# Altium schematic sheet ESP-C05.schdoc
size A4
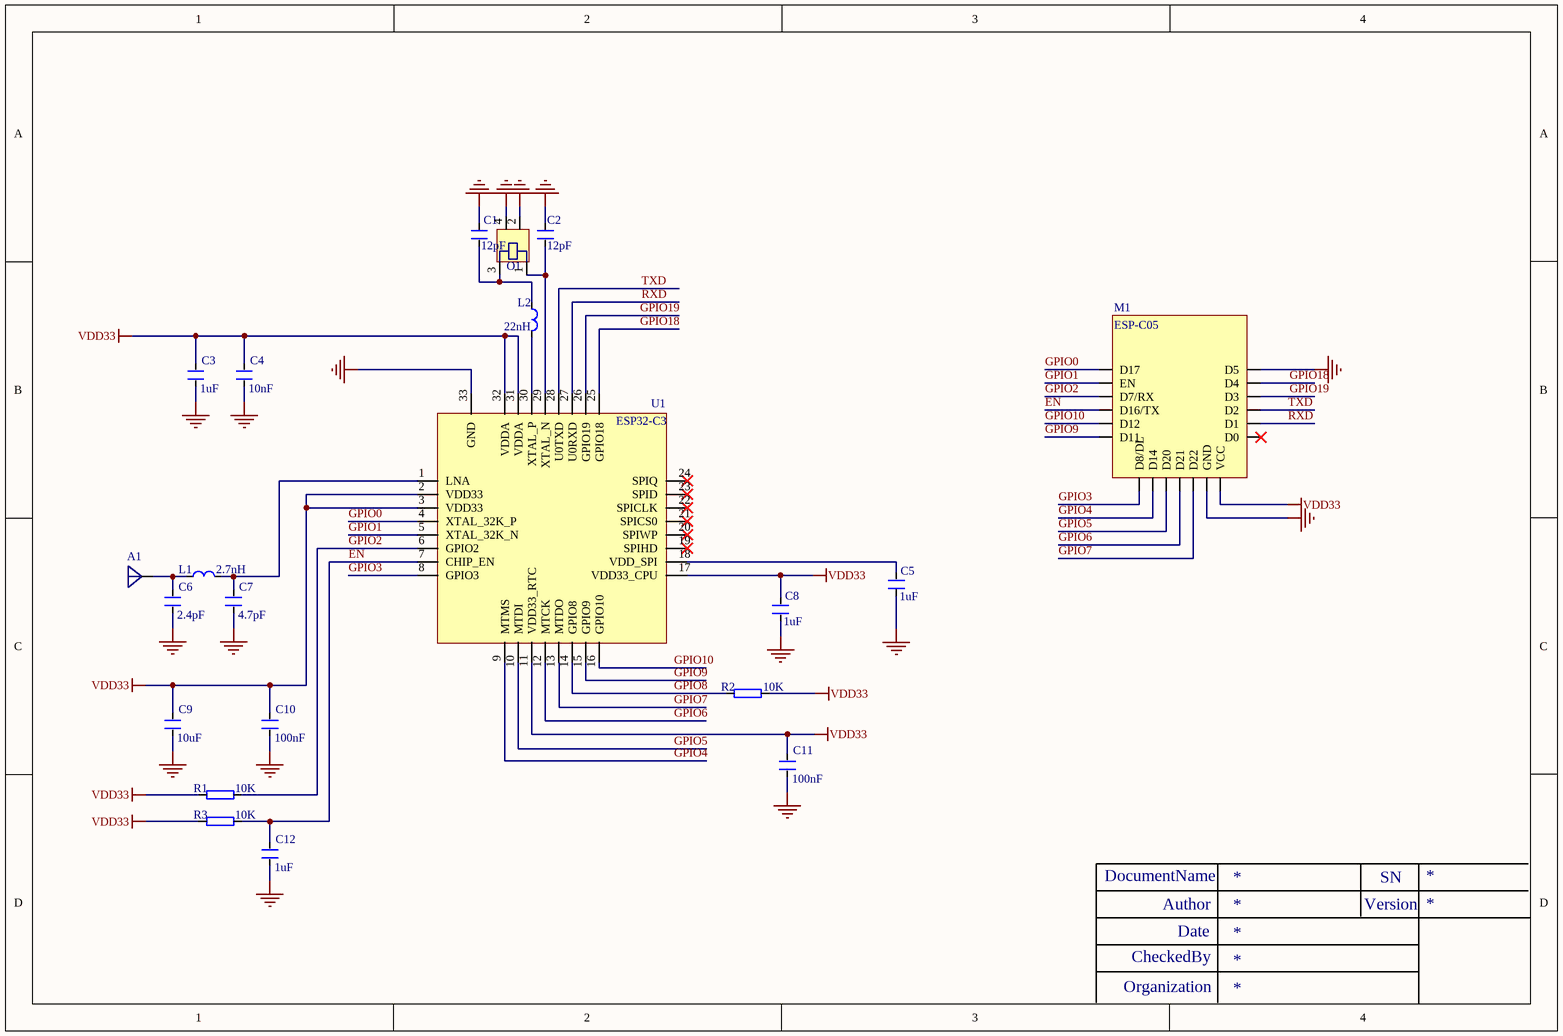
[diagram p0: ESP-C05.schdoc]

## Parts
A1  (no value)  [ANT-16]
C1  12pF  [C0402]
C2  12pF  [C0402]
C3  1uF  [C0402]
C4  10nF  [C0402]
C5  1uF  [C0402]
C6  2.4pF  [C0402]
C7  4.7pF  [C0402]
C8  1uF  [C0402]
C9  10uF  [C0402]
C10  100nF  [C0402]
C11  100nF  [C0402]
C12  1uF  [C0402]
L1  2.7nH  [L0402]
L2  22nH  [0201L]
M1  ESP-C05  [DT-BL10 -K]
O1  40MHz  [OSC-3.2x2.5]  (value not drawn)
R1  10K  [R0402]
R2  10K  [R0402]
R3  10K  [R0402]
U1  ESP32-C3  [QFN32-ESP8266]

## Nets
GND: C1.2 C2.2 C3.1 C4.1 C5.1 C6.1 C7.1 C8.1 C9.1 C10.1 C11.1 C12.1 M1.6(GND) M1.13(D5) O1.2 O1.4 U1.33(GND)
VDD33: C3.2 C4.2 C8.2 C9.2 C10.2 C11.2 M1.7(VCC) R1.1 R2.2 R3.1 U1.2(VDD33) U1.3(VDD33) U1.11(VDD33_RTC) U1.17(VDD33_CPU) U1.31(VDDA) U1.32(VDDA)
EN: C12.2 M1.17(D16/TX) R3.2 U1.7(CHIP_EN)
GPIO0: M1.14(D17) U1.4(XTAL_32K_P)
GPIO1: M1.15(EN) U1.5(XTAL_32K_N)
GPIO2: M1.16(D7/RX) R1.2 U1.6(GPIO2)
GPIO3: M1.1(D8/DL) U1.8(GPIO3)
GPIO4: M1.2(D14) U1.9(MTMS)
GPIO5: M1.3(D20) U1.10(MTDI)
GPIO6: M1.4(D21) U1.12(MTCK)
GPIO7: M1.5(D22) U1.13(MTDO)
GPIO8: R2.1 U1.14(GPIO8)
GPIO9: M1.19(D11) U1.15(GPIO9)
GPIO10: M1.18(D12) U1.16(GPIO10)
GPIO18: M1.12(D4) U1.25(GPIO18)
GPIO19: M1.11(D3) U1.26(GPIO19)
RXD: M1.9(D1) U1.27(U0RXD)
TXD: M1.10(D2) U1.28(U0TXD)
NetA1_1: A1.1 C6.2 L1.1
NetC1_1: C1.1 L2.1 O1.3
NetC2_1: C2.1 O1.1 U1.29(XTAL_N)
NetC5_2: C5.2 U1.18(VDD_SPI)
NetC7_2: C7.2 L1.2 U1.1(LNA)
NetL2_2: L2.2 U1.30(XTAL_P)

Not connected (* = marked no-connect by the designer): M1 8(D0)*; U1 19(SPIHD)* 20(SPIWP)* 21(SPICS0)* 22(SPICLK)* 23(SPID)* 24(SPIQ)*

## Notes on the sheet
- DocumentName
- Author
- Version
- SN
- CheckedBy
- Date
- Organization

## Library data of the parts
A1 = ANT
C1-C12 = Cap: Capacitor
L1 L2 = L: Inductor; Code_IEC: 1005; Value: 10mH; Published: 8-Jun-2000; LatestRevisionDate: 29-May-2009; LatestRevisionNote: IPC-7351 Footprint Added.; PackageReference: 0402-A; Publisher: Altium Limited; PackageDescription: Chip Inductor; Code_JEITA: 0402
M1 = DT-BL10
O1 = OSC-SMA
R1-R3 = R: Resistor
U1 = ESP32-C3: PART DESC: SINGLE-CHIP USB TO UART BRIDGE, QFN28, RoHS.; PART NUMBER: CP2102; MFG #1: SILICON LABS; Value: Value; RefDes: RefDes; Type: DEV